# Altium schematic sheet Sensors-Sheet-1.SchDoc (part 1 of 3)
size 420 x 297 mm; SheetNumber: 22; SheetTotal: 24
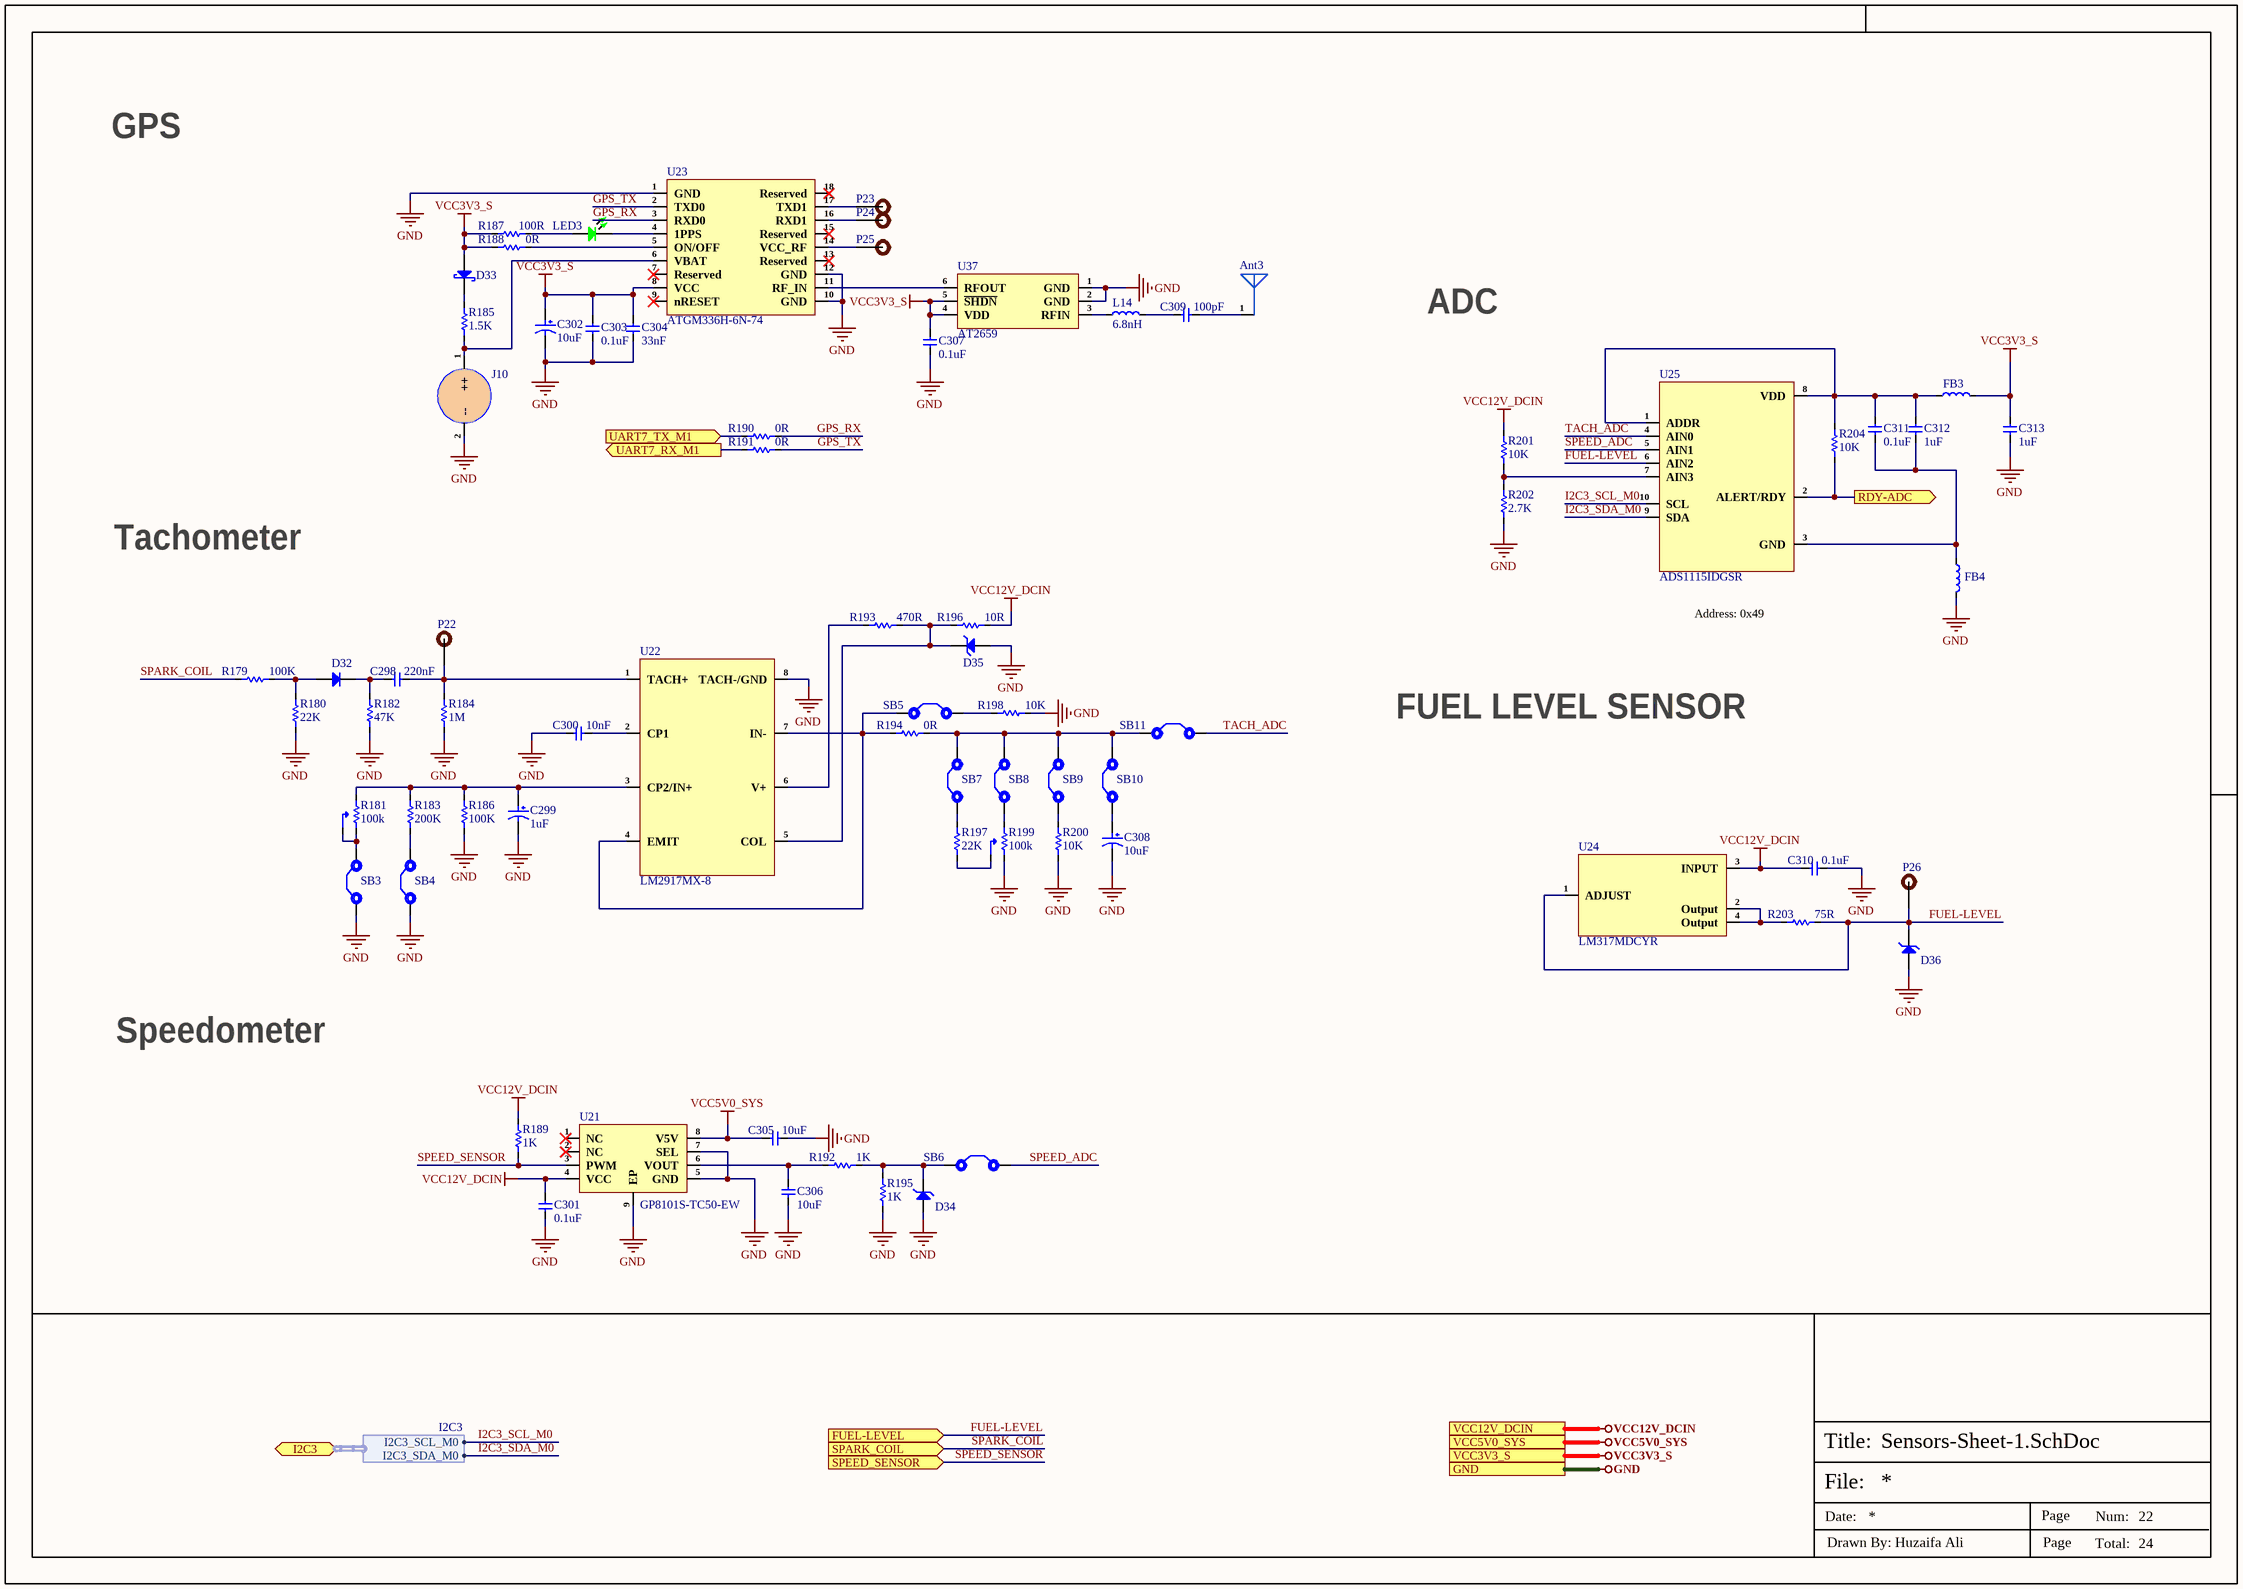
[diagram p0: Sensors-Sheet-1.SchDoc]

## Parts
Ant3  KH-GPS181804-WY  [KH-GPS181804-WY]  (value not drawn)
C298  220nF  [Cap-1210]
C299  1uF  [RVT1H1R0M0405]
C300  10nF  [Cap-0805]
C301  0.1uF  [Cap-0402]
C302  10uF  [RVT1E100M0405_]
C303  0.1uF  [Cap-0402]
C304  33nF  [Cap-0402]
C305  10uF  [Cap-0805]
C306  10uF  [Cap-0805]
C307  0.1uF  [Cap-0402]
C308  10uF  [50SVPF10M]
C309  100pF  [Cap-0603]
C310  0.1uF  [Cap-0402]
C311  0.1uF  [Cap-0402]
C312  1uF  [Cap-0402]
C313  1uF  [Cap-0402]
D32  1N4007- SMD  [SMA(DO-214AC)]  (value not drawn)
D33  B5819WS  [SOD-323]  (value not drawn)
D34  PESDHC3D3V3U  [SOD-323]  (value not drawn)
D35  BZT52C16  [SOD-123]  (value not drawn)
D36  MSP3V3HM3/89A  [MicroSMP]  (value not drawn)
FB3  MMZ2012R102ATD25  [Ind-0805]  (value not drawn)
FB4  MMZ2012R102ATD25  [Ind-0805]  (value not drawn)
J10  PB-621SR13-TF  [PB-621SR13-TF]  (value not drawn)
L14  6.8nH  [Ind-0805]
LED3  Emerald  [LED-0603]  (value not drawn)
P22  TEST POINT 0.5mm Dia  [Test-point - 0.5mm]  (value not drawn)  (no BOM)
P23  TEST POINT 0.5mm Dia  [Test-point - 0.5mm]  (value not drawn)  (no BOM)
P24  TEST POINT 0.5mm Dia  [Test-point - 0.5mm]  (value not drawn)  (no BOM)
P25  TEST POINT 0.5mm Dia  [Test-point - 0.5mm]  (value not drawn)  (no BOM)
P26  TEST POINT 0.5mm Dia  [Test-point - 0.5mm]  (value not drawn)  (no BOM)
R179  100K  [RES-0805]
R180  22K  [Res-0603]
R181  100k  [TC33X-2-104E_]
R182  47K  [Res-0603]
R183  200K  [Res-0402]
R184  1M  [RES-0805]
R185  1.5K  [Res-0402]
R186  100K  [Res-0402]
R187  100R  [Res-0402]
R188  0R  [Res-0402]
R189  1K  [Res-0402]
R190  0R  [Res-0402]
R191  0R  [Res-0402]
R192  1K  [Res-0603]
R193  470R  [Res-0603]
R194  0R  [Res-0805]
R195  1K  [Res-0603]
R196  10R  [Res-0603]
R197  22K  [Res-0603]
R198  10K  [Res-0402]
R199  100k  [TC33X-2-104E_]
R200  10K  [Res-0402]
R201  10K  [Res-0603]
R202  2.7K  [Res-0603]
R203  75R  [Res-0603]
R204  10K  [Res-0402]
SB3  Solder Bridge 0603  [Solder Bridge]  (value not drawn)  (no BOM)
SB4  Solder Bridge 0603  [Solder Bridge]  (value not drawn)  (no BOM)
SB5  Solder Bridge 0603  [Solder Bridge]  (value not drawn)  (no BOM)
SB6  Solder Bridge 0603  [Solder Bridge]  (value not drawn)  (no BOM)
SB7  Solder Bridge 0603  [Solder Bridge]  (value not drawn)  (no BOM)
SB8  Solder Bridge 0603  [Solder Bridge]  (value not drawn)  (no BOM)
SB9  Solder Bridge 0603  [Solder Bridge]  (value not drawn)  (no BOM)
SB10  Solder Bridge 0603  [Solder Bridge]  (value not drawn)  (no BOM)
SB11  Solder Bridge 0603  [Solder Bridge]  (value not drawn)  (no BOM)
U21  GP8101S-TC50-EW  [ESOP-8]
U22  LM2917MX-8  [SOIC-8(0.154", 3.90mm Width)]
U23  ATGM336H-6N-74  [ATGM336H-6N-74]
U24  LM317MDCYR  [SOT- 223]
U25  ADS1115IDGSR  [VSSOP-10]
U37  AT2659  [DFN-6(1x1.6)]

## Ports
FUEL-LEVEL (in, see Connector-Sheet[1D]), GND (see CAN-Bus-SPI-Flash-Sheet[4D], Connector-Sheet[5D], DRAM-LPDDR4x-Sheet[4D], eMMC-Sheet[4D], LED-Debug-Sheet[4D], Power-DC-IN-Sheet[4D], Power-Others-Sheet[4D], Power-PMIC-Sheet[4D], RK3568-Audio-Interface[4D], RK3568-Flash-SD-Controller[4D], RK3568-OSC-PMUIO-Sheet[5D], RK3568-Power-Sheet[4D], RK3568-SARADC-GPIO[4D], RK3568-USB-PCIe-Sheet[5D], RK3568-VI-Interface-Sheet[4D], RK3568-VO-Interface-1[4D], RK3568-VO-Interface-2[4D], Sensors-Sheet-2[5D], Type-C-Sheet[4D], USB-Ports[4D], VO-LCM-MIPI-DSI-TX0[4D], WIFI-BT-SDIO-Sheet[4D]), I2C3 (bidir, harness I2C3, see RK3568-Audio-Interface[3D], Sensors-Sheet-2[4D]), RDY-ADC (out, see RK3568-OSC-PMUIO-Sheet[5B]), SPARK_COIL (in, see Connector-Sheet[1D]), SPEED_SENSOR (in, see Connector-Sheet[1D]), UART7_RX_M1 (out, see RK3568-VO-Interface-2[3C]), UART7_TX_M1 (in, see RK3568-VO-Interface-2[3C]), VCC3V3_S (see LED-Debug-Sheet[4D], Power-DC-IN-Sheet[4D], Sensors-Sheet-2[5D], Type-C-Sheet[4D], VO-LCM-MIPI-DSI-TX0[4D], WIFI-BT-SDIO-Sheet[4D]), VCC5V0_SYS (see Power-DC-IN-Sheet[4D], Power-Others-Sheet[4D], Power-PMIC-Sheet[4D], VO-LCM-MIPI-DSI-TX0[4D]), VCC12V_DCIN (see Connector-Sheet[5D], Power-DC-IN-Sheet[4D], Sensors-Sheet-2[5D])

## Harnesses
I2C3: I2C3_SCL_M0, I2C3_SDA_M0

## Nets
GND: C299.2 C300.1 C301.1 C302.2 C303.1 C304.1 C305.1 C306.2 C307.1 C308.2 C310.1 C313.2 D34.2(A) D35.1(A) D36.1(A) FB4.2 J10.2(--) R180.1 R182.1 R184.1 R186.1 R195.1 R198.2 R199.1(CCW) R200.1 R202.1 SB3.1 SB4.1 U21.5(GND) U21.7(SEL) U21.9(EP) U22.8(TACH-/GND) U23.1(GND) U23.10(GND) U23.12(GND) U37.1(GND) U37.2(GND) ; port GND
VCC3V3_S: C302.1 C303.2 C304.2 C307.2 C313.1 D33.2(A) FB3.2 R187.1 R188.1 U23.8(VCC) U37.4(VDD) U37.5(~{SH}~{DN}) ; port VCC3V3_S
VCC5V0_SYS: C305.2 U21.8(V5V) ; port VCC5V0_SYS
VCC12V_DCIN: C301.2 C310.2 R189.2 R196.2 R201.2 U21.4(VCC) U24.3(INPUT) ; port VCC12V_DCIN
FUEL-LEVEL: D36.2(K) P26.1 R203.2 U24.1(ADJUST) U25.6(AIN2) ; port FUEL-LEVEL
GPS_RX: R190.2 U23.3(RXD0)
GPS_TX: R191.2 U23.2(TXD0)
I2C3_SCL_M0: U25.10(SCL) ; port I2C3.I2C3_SCL_M0
I2C3_SDA_M0: U25.9(SDA) ; port I2C3.I2C3_SDA_M0
RDY-ADC: R204.1 U25.2(ALERT/RDY) ; port RDY-ADC
SPARK_COIL: R179.1 ; port SPARK_COIL
SPEED_ADC: SB6.2 U25.5(AIN1)
SPEED_SENSOR: R189.1 U21.3(PWM) ; port SPEED_SENSOR
TACH_ADC: SB11.2 U25.4(AIN0)
UART7_RX_M1: R191.1 ; port UART7_RX_M1
UART7_TX_M1: R190.1 ; port UART7_TX_M1
NetAnt3_1: Ant3.1 C309.2
NetC298_1: C298.1 P22.1 R184.2 U22.1(TACH+)
NetC298_2: C298.2 D32.1(K) R182.2
NetC299_1: C299.1 R181.3(CW) R183.2 R186.2 U22.3(CP2/IN+)
NetC300_2: C300.2 U22.2(CP1)
NetC306_1: C306.1 R192.1 U21.6(VOUT)
NetC308_1: C308.1 SB10.1
NetC309_1: C309.1 L14.2
NetC311_1: C311.1 C312.1 FB3.1 R204.2 U25.1(ADDR) U25.8(VDD)
NetC311_2: C311.2 C312.2 FB4.1 U25.3(GND)
NetD32_2: D32.2(A) R179.2 R180.2
NetD33_1: D33.1(K) R185.2
NetD34_1: D34.1(C) R192.2 R195.2 SB6.1
NetD35_2: D35.2(K) R193.2 R196.1 U22.5(COL)
NetJ10_1: J10.1(++) R185.1 U23.6(VBAT)
NetL14_1: L14.1 U37.3(RFIN)
NetLED3_1: LED3.1 R187.2
NetLED3_2: LED3.2 U23.4(1PPS)
NetP23_1: P23.1 U23.17(TXD1)
NetP24_1: P24.1 U23.16(RXD1)
NetP25_1: P25.1 U23.14(VCC_RF)
NetR181_1: R181.1(CCW) R181.2(Wiper) SB3.2
NetR183_1: R183.1 SB4.2
NetR188_2: R188.2 U23.5(ON/OFF)
NetR193_1: R193.1 U22.6(V+)
NetR194_1: R194.1 SB5.1 U22.4(EMIT) U22.7(IN-)
NetR194_2: R194.2 SB7.2 SB8.2 SB9.2 SB10.2 SB11.1
NetR197_1: R197.1 R199.2(Wiper)
NetR197_2: R197.2 SB7.1
NetR198_1: R198.1 SB5.2
NetR199_3: R199.3(CW) SB8.1
NetR200_2: R200.2 SB9.1
NetR201_1: R201.1 R202.2 U25.7(AIN3)
NetR203_1: R203.1 U24.2(Output) U24.4(Output)
NetU23_11: U23.11(RF_IN) U37.6(RFOUT)

Not connected (* = marked no-connect by the designer): U21 1(NC)* 2(NC)*; U23 7(Reserved)* 9(nRESET)* 13(Reserved)* 15(Reserved)* 18(Reserved)*

## Notes on the sheet
- GPS
- ADC
- Tachometer
- Address: 0x49
- FUEL LEVEL SENSOR
- Speedometer
- File:
- Title:
- Date:
- Page
- Num:
- Total:
- Drawn By: Huzaifa Ali